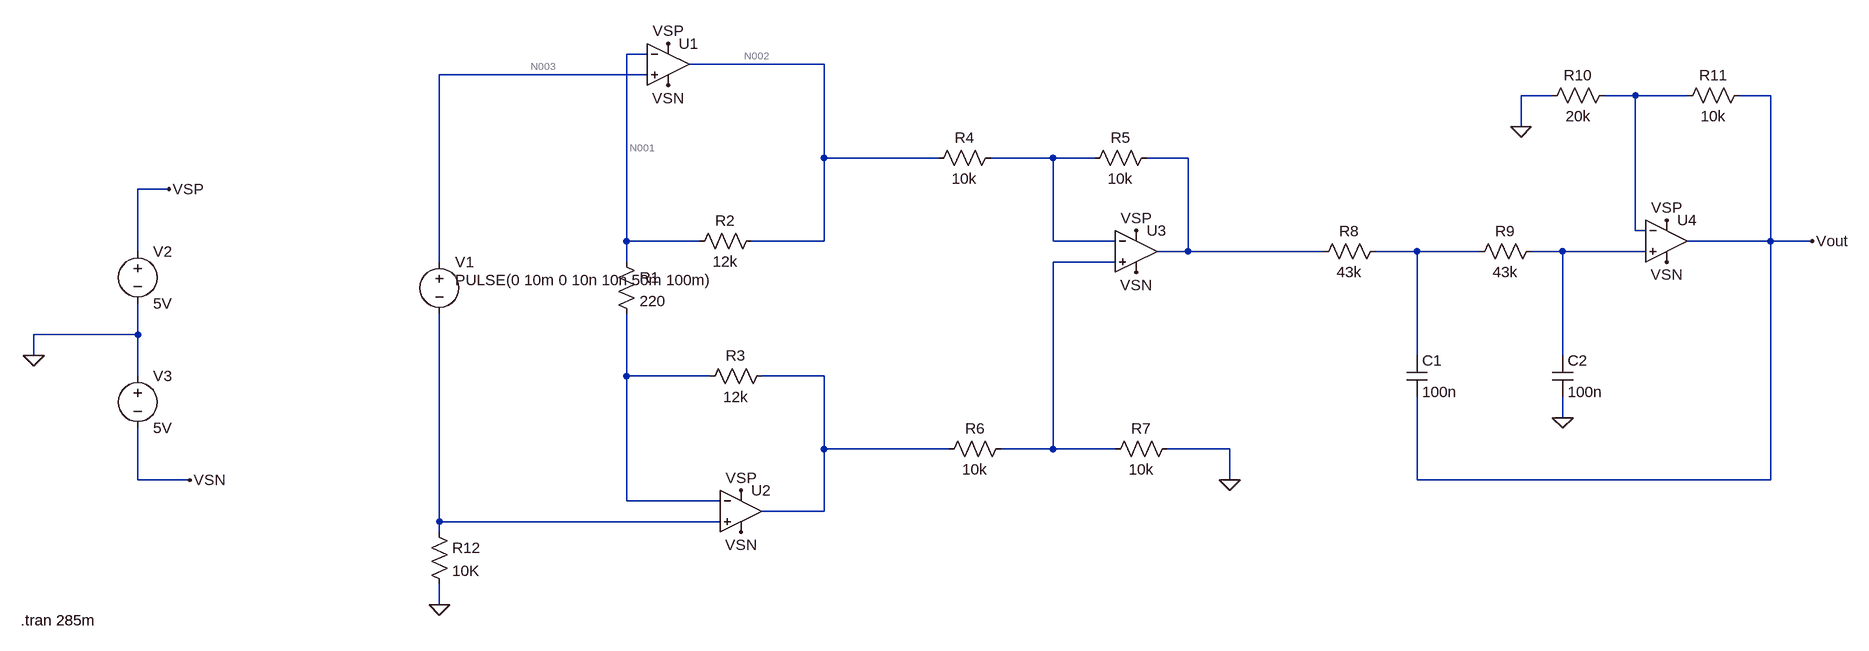
[diagram p0: schematic Draft4.asc]
Draft4.asc, the LTspice schematic file:
Version 4
SHEET 1 2756 792
WIRE 848 -96 816 -96
WIRE 1120 -80 912 -80
WIRE 848 -64 528 -64
WIRE 2240 -32 2192 -32
WIRE 2368 -32 2320 -32
WIRE 2448 -32 2368 -32
WIRE 2576 -32 2528 -32
WIRE 2192 16 2192 -32
WIRE 1120 64 1120 -80
WIRE 1296 64 1120 64
WIRE 1472 64 1376 64
WIRE 1536 64 1472 64
WIRE 1680 64 1616 64
WIRE 112 112 64 112
WIRE 2368 176 2368 -32
WIRE 2384 176 2368 176
WIRE 816 192 816 -96
WIRE 928 192 816 192
WIRE 1120 192 1120 64
WIRE 1120 192 1008 192
WIRE 1472 192 1472 64
WIRE 1568 192 1472 192
WIRE 2576 192 2576 -32
WIRE 2576 192 2448 192
WIRE 2640 192 2576 192
WIRE 64 208 64 112
WIRE 1680 208 1680 64
WIRE 1680 208 1632 208
WIRE 1888 208 1680 208
WIRE 2032 208 1968 208
WIRE 2128 208 2032 208
WIRE 2256 208 2208 208
WIRE 2384 208 2256 208
WIRE 528 224 528 -64
WIRE 816 224 816 192
WIRE 1568 224 1472 224
WIRE 64 336 64 288
WIRE 64 336 -96 336
WIRE -96 368 -96 336
WIRE 2032 368 2032 208
WIRE 2256 368 2256 208
WIRE 64 400 64 336
WIRE 816 400 816 304
WIRE 944 400 816 400
WIRE 1120 400 1024 400
WIRE 2256 464 2256 432
WIRE 1120 512 1120 400
WIRE 1312 512 1120 512
WIRE 1472 512 1472 224
WIRE 1472 512 1392 512
WIRE 1568 512 1472 512
WIRE 1744 512 1648 512
WIRE 64 560 64 480
WIRE 144 560 64 560
WIRE 1744 560 1744 512
WIRE 2032 560 2032 432
WIRE 2576 560 2576 192
WIRE 2576 560 2032 560
WIRE 816 592 816 400
WIRE 960 592 816 592
WIRE 1120 608 1120 512
WIRE 1120 608 1024 608
WIRE 528 624 528 304
WIRE 960 624 528 624
WIRE 528 640 528 624
WIRE 528 752 528 720
FLAG -96 368 0
FLAG 144 560 VSN
FLAG 112 112 VSP
FLAG 528 752 0
FLAG 880 -48 VSN
FLAG 880 -112 VSP
FLAG 992 576 VSP
FLAG 992 640 VSN
FLAG 1600 240 VSN
FLAG 1600 176 VSP
FLAG 1744 560 0
FLAG 2416 160 VSP
FLAG 2416 224 VSN
FLAG 2256 464 0
FLAG 2640 192 Vout
FLAG 2192 16 0
SYMBOL voltage 64 192 R0
SYMATTR InstName V2
SYMATTR Value 5V
SYMBOL voltage 64 384 R0
SYMATTR InstName V3
SYMATTR Value 5V
SYMBOL voltage 528 208 R0
WINDOW 3 24 44 Left 2
WINDOW 123 0 0 Left 0
WINDOW 39 0 0 Left 0
SYMATTR InstName V1
SYMATTR Value PULSE(0 10m 0 10n 10n 50m 100m)
SYMBOL res 512 624 R0
SYMATTR InstName R12
SYMATTR Value 10K
SYMBOL OpAmps\\UniversalOpAmp2 2416 192 R0
SYMATTR InstName U4
SYMBOL OpAmps\\UniversalOpAmp2 992 608 R0
SYMATTR InstName U2
SYMBOL OpAmps\\UniversalOpAmp2 1600 208 R0
SYMATTR InstName U3
SYMBOL OpAmps\\UniversalOpAmp2 880 -80 R0
SYMATTR InstName U1
SYMBOL res 800 208 R0
SYMATTR InstName R1
SYMATTR Value 220
SYMBOL res 1024 176 R90
WINDOW 0 0 56 VBottom 2
WINDOW 3 32 56 VTop 2
SYMATTR InstName R2
SYMATTR Value 12k
SYMBOL res 1040 384 R90
WINDOW 0 0 56 VBottom 2
WINDOW 3 32 56 VTop 2
SYMATTR InstName R3
SYMATTR Value 12k
SYMBOL res 1392 48 R90
WINDOW 0 0 56 VBottom 2
WINDOW 3 32 56 VTop 2
SYMATTR InstName R4
SYMATTR Value 10k
SYMBOL res 1408 496 R90
WINDOW 0 0 56 VBottom 2
WINDOW 3 32 56 VTop 2
SYMATTR InstName R6
SYMATTR Value 10k
SYMBOL res 1632 48 R90
WINDOW 0 0 56 VBottom 2
WINDOW 3 32 56 VTop 2
SYMATTR InstName R5
SYMATTR Value 10k
SYMBOL res 1664 496 R90
WINDOW 0 0 56 VBottom 2
WINDOW 3 32 56 VTop 2
SYMATTR InstName R7
SYMATTR Value 10k
SYMBOL res 1984 192 R90
WINDOW 0 0 56 VBottom 2
WINDOW 3 32 56 VTop 2
SYMATTR InstName R8
SYMATTR Value 43k
SYMBOL res 2224 192 R90
WINDOW 0 0 56 VBottom 2
WINDOW 3 32 56 VTop 2
SYMATTR InstName R9
SYMATTR Value 43k
SYMBOL cap 2016 368 R0
SYMATTR InstName C1
SYMATTR Value 100n
SYMBOL cap 2240 368 R0
SYMATTR InstName C2
SYMATTR Value 100n
SYMBOL res 2336 -48 R90
WINDOW 0 0 56 VBottom 2
WINDOW 3 32 56 VTop 2
SYMATTR InstName R10
SYMATTR Value 20k
SYMBOL res 2544 -48 R90
WINDOW 0 0 56 VBottom 2
WINDOW 3 32 56 VTop 2
SYMATTR InstName R11
SYMATTR Value 10k
TEXT -116 776 Left 2 !.tran 285m

The netlist it stands for:
* Draft4.asc
V2 VSP 0 5V
V3 0 VSN 5V
V1 N003 N012 PULSE(0 10m 0 10n 10n 50m 100m)
R12 N012 0 10K
XU4 N008 N004 VSP VSN Vout level2 Avol=1Meg GBW=10Meg Slew=10Meg Ilimit=25m Rail=0 Vos=0 En=0 Enk=0 In=0 Ink=0 Rin=500Meg  ; pins In+ In- V+ V- OUT
XU2 N012 N010 VSP VSN N011 level2 Avol=1Meg GBW=10Meg Slew=10Meg Ilimit=25m Rail=0 Vos=0 En=0 Enk=0 In=0 Ink=0 Rin=500Meg  ; pins In+ In- V+ V- OUT
XU3 N009 N005 VSP VSN N006 level2 Avol=1Meg GBW=10Meg Slew=10Meg Ilimit=25m Rail=0 Vos=0 En=0 Enk=0 In=0 Ink=0 Rin=500Meg  ; pins In+ In- V+ V- OUT
XU1 N003 N001 VSP VSN N002 level2 Avol=1Meg GBW=10Meg Slew=10Meg Ilimit=25m Rail=0 Vos=0 En=0 Enk=0 In=0 Ink=0 Rin=500Meg  ; pins In+ In- V+ V- OUT
R1 N001 N010 220
R2 N002 N001 12k
R3 N011 N010 12k
R4 N005 N002 10k
R6 N009 N011 10k
R5 N006 N005 10k
R7 0 N009 10k
R8 N007 N006 43k
R9 N008 N007 43k
C1 N007 Vout 100n
C2 N008 0 100n
R10 N004 0 20k
R11 Vout N004 10k
.tran 285m
.lib UniversalOpAmp2.lib
.backanno
.end

* Results of the author's LTspice run, read from the files saved beside the schematic
* Operating Point, zero values left out:
*   V(vsp) = 5 V
*   V(vsn) = -5 V
*   I(V3) = -2 mA
*   I(V2) = -2 mA
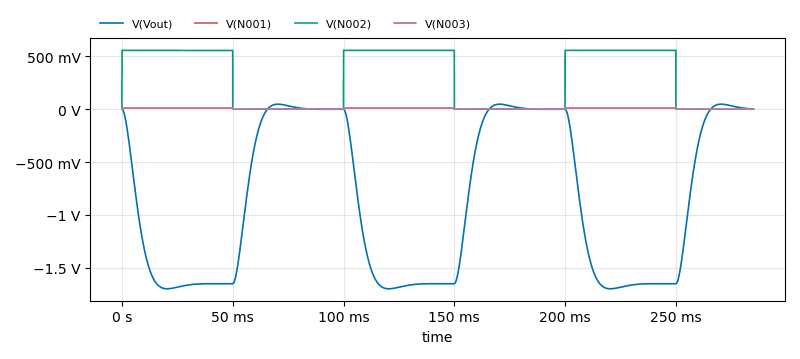
[diagram p1: Transient Analysis of Draft4.asc, plotted from the saved traces]
* Transient Analysis, 1 run:
*   V(Vout): min -1.698 V, max 46.92 mV, average -868.9 mV, rms 1.154 V, last 966 µV
*   V(N001): min -239.8 nV, max 9.999 mV, average 5.263 mV, rms 7.254 mV, last 2.09 nV
*   V(N002): min -27.72 µV, max 555.4 mV, average 292.3 mV, rms 402.9 mV, last 0 V
*   V(N003): min 0 V, max 10 mV, average 5.263 mV, rms 7.255 mV, last 0 V